# EasyEDA Pro project ProPrj_1_2026-08-19.epro

# Schematic Schematic1
Board Name: Board1; Create Date: 2026-07-23; Page Name: P1; Project Name: 1; Schematic Name: Schematic1; Update Date: 2026-07-23; Company: 嘉立创EDA; Page Size: A4; Version: V1.0
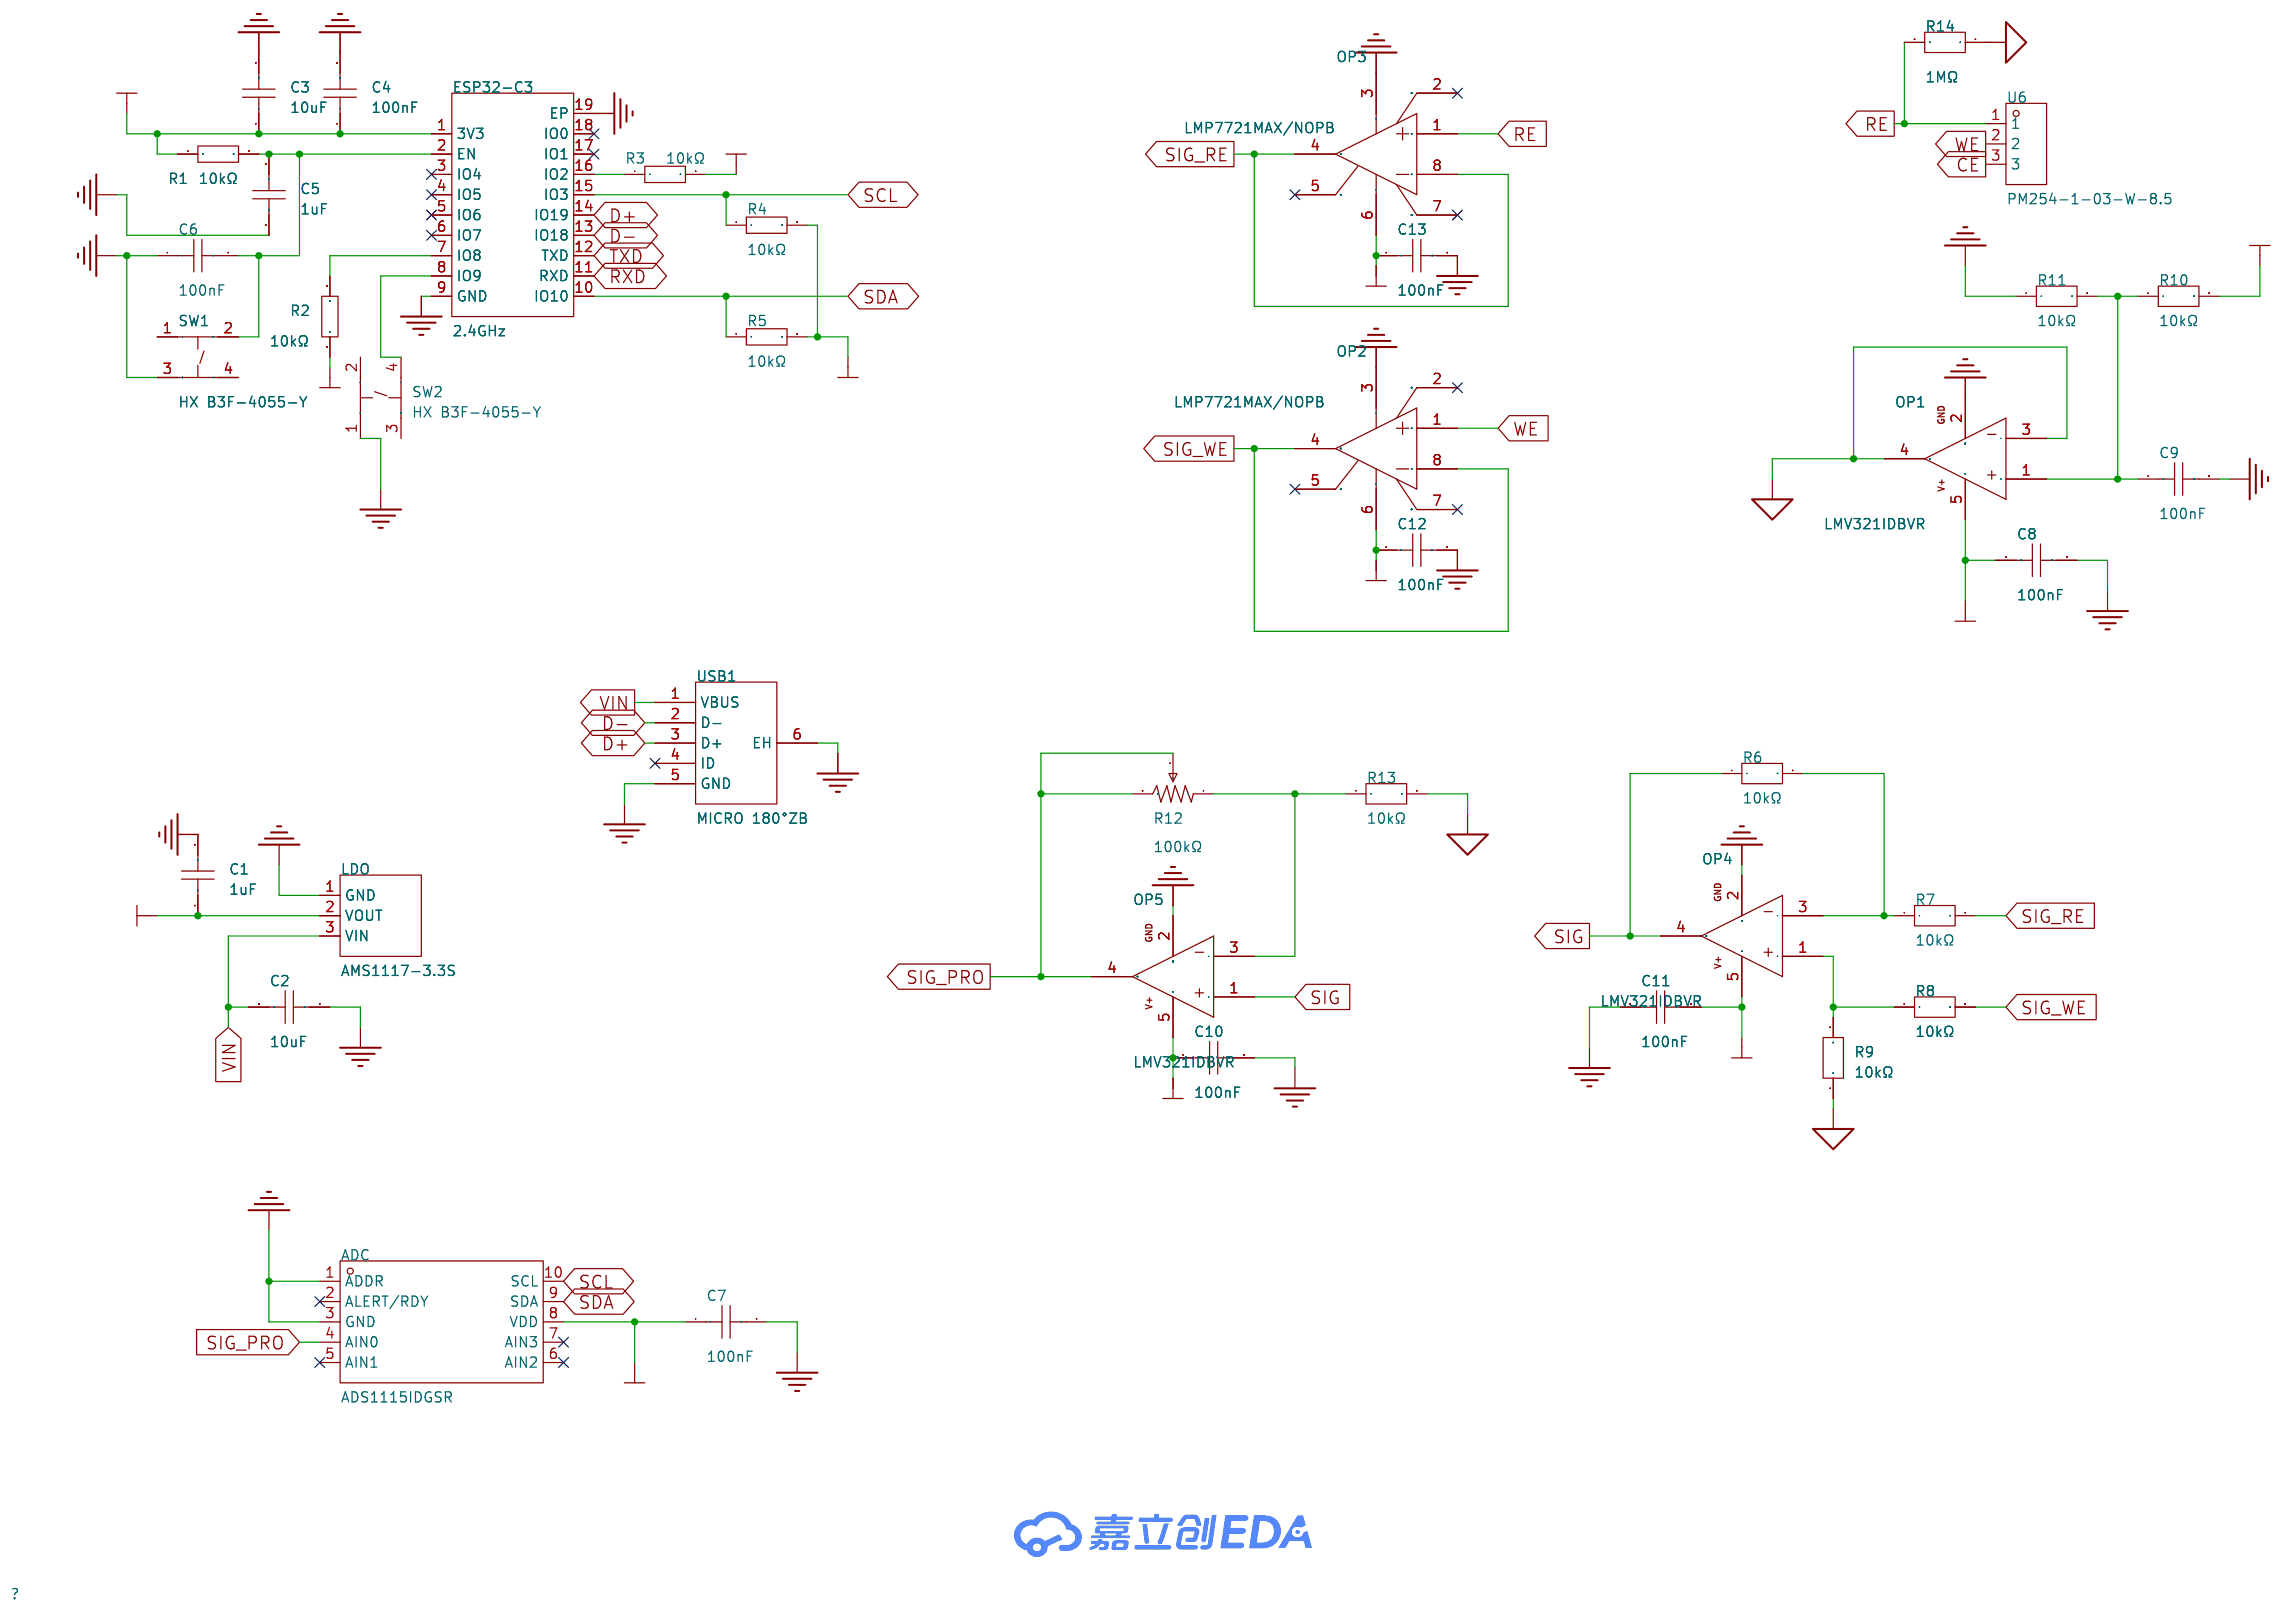
[diagram p0: schematic sheet]

## Parts
ADC  ADS1115IDGSR  [MSOP-10_L3.0-W3.0-P0.50-LS5.0-BL]
C1  1uF  [CAP-TH_L5.5-W4.0-P5.08-D0.5]
C2  10uF  [CAP-TH_L5.5-W3.8-P5.08-D0.5]
C3  10uF  [CAP-TH_L5.5-W3.8-P5.08-D0.5]
C4  100nF  [CAP-TH_L4.5-W3.5-P5.08-D0.5]
C5  1uF  [CAP-TH_L5.5-W4.0-P5.08-D0.5]
C6  100nF  [CAP-TH_L4.5-W3.5-P5.08-D0.5]
C7  100nF  [CAP-TH_L4.5-W3.5-P5.08-D0.5]
C8  100nF  [CAP-TH_L4.5-W3.5-P5.08-D0.5]
C9  100nF  [CAP-TH_L4.5-W3.5-P5.08-D0.5]
C10  100nF  [CAP-TH_L4.5-W3.5-P5.08-D0.5]
C11  100nF  [CAP-TH_L4.5-W3.5-P5.08-D0.5]
C12  100nF  [CAP-TH_L4.5-W3.5-P5.08-D0.5]
C13  100nF  [CAP-TH_L4.5-W3.5-P5.08-D0.5]
ESP32-C3  2.4GHz  [BULETM-SMD_ESPRESSIF_ESP32-C3-WROOM-02-N4-4MB]
LDO  AMS1117-3.3S  [SOT-89-3_L4.5-W2.5-P1.50-LS4.2-BR]
OP1  LMV321IDBVR  [SOT-23-5_L3.0-W1.7-P0.95-LS2.8-BR]
OP2  LMP7721MAX/NOPB  [SOIC-8_L4.9-W3.9-P1.27-LS6.0-BL]
OP3  LMP7721MAX/NOPB  [SOIC-8_L4.9-W3.9-P1.27-LS6.0-BL]
OP4  LMV321IDBVR  [SOT-23-5_L3.0-W1.7-P0.95-LS2.8-BR]
OP5  LMV321IDBVR  [SOT-23-5_L3.0-W1.7-P0.95-LS2.8-BR]
R1  10kΩ  [RES-TH_BD2.4-L6.3-P10.30-D0.6]
R2  10kΩ  [RES-TH_BD2.4-L6.3-P10.30-D0.6]
R3  10kΩ  [RES-TH_BD2.4-L6.3-P10.30-D0.6]
R4  10kΩ  [RES-TH_BD2.4-L6.3-P10.30-D0.6]
R5  10kΩ  [RES-TH_BD2.4-L6.3-P10.30-D0.6]
R6  10kΩ  [RES-TH_BD2.5-L6.8-P10.00-D0.6]
R7  10kΩ  [RES-TH_BD2.5-L6.8-P10.00-D0.6]
R8  10kΩ  [RES-TH_BD2.5-L6.8-P10.00-D0.6]
R9  10kΩ  [RES-TH_BD2.5-L6.8-P10.00-D0.6]
R10  10kΩ  [RES-TH_BD2.5-L6.8-P10.00-D0.6]
R11  10kΩ  [RES-TH_BD2.5-L6.8-P10.00-D0.6]
R12  100kΩ  [RES-ADJ-TH_3296W-L]
R13  10kΩ  [RES-TH_BD2.5-L6.8-P10.00-D0.6]
R14  1MΩ  [RES-TH_BD2.7-L6.2-P10.20-D0.4]
SW1  HX B3F-4055-Y  [SW-TH_4P-L12.0-W12.0-P5.00-LS12.5_HX-B3F-4055-Y]
SW2  HX B3F-4055-Y  [SW-TH_4P-L12.0-W12.0-P5.00-LS12.5_HX-B3F-4055-Y]
U6  PM254-1-03-W-8.5  [HDR-TH_3P-P2.54-H-F-W10.0-N]
USB1  MICRO 180°ZB  [MICRO-USB-TH_MICRO-180-ZB]

## Library data of the parts
ADC = ADS1115IDGSR: 分辨率(位):16;采样率:860Hz;工作电压:2V~5.5V;接口类型:I2C;; LCSC Part Name: 具有内部基准、振荡器和可编程比较器且兼容 I2C 的ADS111x、超小型、低功耗 860SPS、16位ADC; Supplier Part: C37593; Manufacturer: TI(德州仪器); Supplier Footprint: VSSOP-10; JLCPCB Part Class: 扩展库; Datasheet: https://www.ti.com/cn/lit/ds/symlink/ads1115.pdf; Supplier: LCSC; Resolution (Bits): 16; Sampling Rate: 860Hz; number of channels: 2; Voltage - Supply: 2V~5.5V; Interface: I2C; differential input: 是; Integral non - linearity: 1LSB; Operating Temperature: -40℃~+125℃; Clock/Oscillator: 内置; Voltage Reference: 内置; Programmable Gain: 支持; ADC architecture: Sigma-Delta; Quiescent Current (Iq): 500nA; Features: 集成调制器；多路复用器；内置数字滤波器；上电复位
C1 C5 = CD2A105KC9IER1FZAE: 容值:1uF;精度:±10%;额定电压:100V;温度系数:X7R;; LCSC Part Name: 1uF ±10% 100V; Supplier Part: C3293123; Manufacturer: Dersonic(德尔创); Supplier Footprint: 插件,P=5.08mm; JLCPCB Part Class: 扩展库; Datasheet: https://item.szlcsc.com/datasheet/CD2A105KC9IER1FZAE/3856453.html; Supplier: LCSC; Tolerance: ±10%; Voltage Rating: 100V; Temperature Coefficient: X7R
C2 C3 = CD1E106MC9BER2F100: 容值:10uF;精度:±20%;额定电压:25V;温度系数:X5R;; LCSC Part Name: 10uF ±20% 25V; Supplier Part: C2761733; Manufacturer: Dersonic(德尔创); Supplier Footprint: 插件,P=5.08mm; JLCPCB Part Class: 扩展库; Datasheet: https://item.szlcsc.com/datasheet/CD1E106MC9BER2F100/2886480.html; Supplier: LCSC; Tolerance: ±20%; Voltage Rating: 25V; Temperature Coefficient: X5R
C4 C6-C13 = CD2A104KC9BER1E100: 容值:100nF;精度:±10%;额定电压:100V;温度系数:X7R;; LCSC Part Name: 100nF ±10% 100V; Supplier Part: C2761758; Manufacturer: Dersonic(德尔创); Supplier Footprint: 插件,P=5.08mm; JLCPCB Part Class: 扩展库; Datasheet: https://item.szlcsc.com/datasheet/CD2A104KC9BER1E100/2886505.html; Supplier: LCSC; Tolerance: ±10%; Voltage Rating: 100V; Temperature Coefficient: X7R; Pin Spacing: 5.08mm
ESP32-C3 = ESP32-C3-WROOM-02-N4: 核心处理器:ESP32-C3芯片;频率:2.4GHz;发射功率:20.5dBm;; Supplier Part: C2934560; Manufacturer: ESPRESSIF(乐鑫); Supplier Footprint: VFQFN-32-EP; JLCPCB Part Class: 扩展库; Datasheet: https://atta.szlcsc.com/upload/public/pdf/source/20220106/F07459EFFE1D7CBA94B4FB8A075146A6.pdf; Supplier: LCSC; Core Processor: ESP32-C3芯片; Support Interface: I2C；GPIO；SPI；JTAG；UART；USB；I2S; Output Power: 20.5dBm
LDO = AMS1117-3.3S_C347256: 输出极性:正极;工作电压:18V;输出电压:3.3V;输出电流:1A;电源纹波抑制比(PSRR):60dB@(120Hz);输出类型:固定;; LCSC Part Name: 3.3V 1A 18V; Supplier Part: C347256; Manufacturer: UMW(友台半导体); Supplier Footprint: SOT-89; JLCPCB Part Class: 扩展库; Datasheet: https://item.szlcsc.com/datasheet/AMS1117-3.3S/323916.html; Supplier: LCSC; Output Configuration: 正极; Voltage - Supply: 18V; Output Voltage: 3.3V; Output Current: 1A; Power Supply Rejection Ratio (PSRR): 60dB@(120Hz); Voltage Dropout: 1.3V@(1A); standby current: 5mA; Noise: 0.003%Vout; Features: 过流保护; Operating Temperature: -40℃~+125℃; Output Type: 固定; Number of Outputs: 1
OP1 OP4 OP5 = LMV321IDBVR_C7972: 放大器数:1;轨到轨:轨到轨输出;增益带宽积(GBW):1MHz;输入失调电压(Vos):7mV;压摆率(SR):1V/us;输入偏置电流(Ib):11nA;; LCSC Part Name: 低电压轨到轨输出运算放大器; Supplier Part: C7972; Manufacturer: TI(德州仪器); Supplier Footprint: SOT-23-5; JLCPCB Part Class: 扩展库; Datasheet: https://www.ti.com/cn/lit/gpn/lmv321; Supplier: LCSC; Number of Channels: 1; Maximum Power Supply Range (Vdd-Vss): 5.5V; Rail to Rail: 轨到轨输出; Gain Bandwidth Product: 1MHz; Vos - Input Offset Voltage: 7mV; Input Offset Voltage Drift(Vos TC): 9uV/℃; Slew Rate: 1V/us; Ib - Input Bias Current: 11nA; Input Offset Current(Ios): 5nA; Input Voltage Noise Density: 46nV/√Hz@1kHz; Common Mode Rejection Ratio(CMRR): 63dB; Quiescent Current: 170uA; Output Current: 5mA; Operating Temperature: -40℃~+125℃; Single supply: 2.7V~5.5V
OP2 OP3 = LMP7721MAX/NOPB: 放大器数:1;轨到轨:轨到轨输出;增益带宽积(GBW):17MHz;输入失调电压(Vos):26uV;压摆率(SR):12.76V/us;输入偏置电流(Ib):0.003pA;; LCSC Part Name: 超低输入偏置电流精密放大器; Supplier Part: C2864387; Manufacturer: TI(德州仪器); Supplier Footprint: SOIC-8; JLCPCB Part Class: 扩展库; Datasheet: https://www.ti.com/cn/lit/gpn/lmp7721; Supplier: LCSC; Number of Channels: 1; Maximum Power Supply Range (Vdd-Vss): 5.5V; Rail to Rail: 轨到轨输出; Gain Bandwidth Product: 17MHz; Vos - Input Offset Voltage: 26uV; Input Offset Voltage Drift(Vos TC): 1.5uV/℃; Slew Rate: 12.76V/us; Ib - Input Bias Current: 0.003pA; Input Offset Current(Ios): 0.006pA; Input Voltage Noise Density: 6.5nV/√Hz@1kHz; Common Mode Rejection Ratio(CMRR): 100dB; Quiescent Current: 1.3mA; Output Current: 46mA; Operating Temperature: -40℃~+125℃; Single supply: 1.8V~5.5V
R1-R5 = MFR-25FTE52-10K: 电阻类型:金属膜电阻;阻值:10kΩ;精度:±1%;功率:250mW;温度系数:±50ppm/℃;; LCSC Part Name: 金属膜电阻 10kΩ ±1% 250mW 铜脚，圆柱状直插; Supplier Part: C172967; Manufacturer: YAGEO(国巨); Supplier Footprint: 插件,D2.4xL6.3mm; JLCPCB Part Class: 扩展库; Datasheet: https://item.szlcsc.com/datasheet/MFR-25FTE52-10K/184356.html; Supplier: LCSC; Type: 金属膜电阻; Tolerance: ±1%; Power(Watts): 250mW; Temperature Coefficient: ±50ppm/℃; Operating Temperature: -55℃~+155℃
R6-R11 R13 = MMFR2568B10K0V9: 电阻类型:金属膜电阻;阻值:10kΩ;精度:±0.1%;功率:250mW;温度系数:±5ppm/℃;; LCSC Part Name: 金属膜电阻 10kΩ ±0.1% 250mW; Supplier Part: C18164721; Manufacturer: RESI(开步睿思); Supplier Footprint: 插件,D2.5xL6.8mm; JLCPCB Part Class: 扩展库; Datasheet: https://item.szlcsc.com/datasheet/MMFR2568B10K0V9/19306716.html; Supplier: LCSC; Type: 金属膜电阻; Tolerance: ±0.1%; Voltage-Supply(Max): 250V; Power(Watts): 250mW; Temperature Coefficient: ±5ppm/℃; Operating Temperature: -55℃~+125℃
R12 = 3296W-104-3H: 阻值:100kΩ;精度:±10%;功率:500mW;温度系数:±250ppm/℃;; LCSC Part Name: 3296W 100KΩ±10% 高精度 高可靠 高稳定; Supplier Part: C48641918; Manufacturer: BAOTER(宝特); Supplier Footprint: 插件-3P,9.5x4.8mm; JLCPCB Part Class: 扩展库; Datasheet: https://item.szlcsc.com/datasheet/3296W-104-3H/50920181.html; Supplier: LCSC; Tolerance: ±10%; Power(Watts): 500mW; Temperature Coefficient: ±250ppm/℃; Number of Turns: 28
R14 = MF1/4W-1M±1%-OT52: 电阻类型:金属膜电阻;阻值:1MΩ;精度:±1%;功率:250mW;温度系数:±100ppm/℃;; LCSC Part Name: 金属膜电阻 1MΩ ±1% 250mW; Supplier Part: C2903250; Manufacturer: VO(翔胜); Supplier Footprint: 插件,D2.7xL6.2mm; JLCPCB Part Class: 扩展库; Datasheet: https://atta.szlcsc.com/upload/public/pdf/source/20200609/C601728_5AA4C0C8E12E11069DA2C3356F29D1F2.pdf; Supplier: LCSC; Type: 金属膜电阻; Tolerance: ±1%; Overload Voltage (Max): 250V; Power(Watts): 250mW; Temperature Coefficient: ±100ppm/℃; Operating Temperature Range: -55℃~+155℃
SW1 SW2 = HX B3F-4055-Y: 电路结构:单刀单掷;按钮形状:方形按钮;作用力:2.5N;安装方式:直插;开关长度:11.8mm;开关宽度:11.8mm;开关高度:7.3mm;带支架:不带支架;触点电流:50mA;额定电压:12V;带灯:无;工作寿命:10万次;; LCSC Part Name: 12*12*7.3mm 直插 轻触开关; Supplier Part: C36498965; Manufacturer: hanxia(韩下); Supplier Footprint: 插件-4P,11.8x11.8mm; JLCPCB Part Class: 扩展库; Datasheet: https://item.szlcsc.com/datasheet/HX%2520B3F-4055-Y/38220907.html; Supplier: LCSC; Circuit: 单刀单掷; Actuator Style: 方形按钮; Operating Force: 2.5N; Mounting Type: 直插; Length: 11.8mm; Width: 11.8mm; Switch Height: 7.3mm; with Bracket: 不带支架; Contact Current: 50mA; Voltage Rating: 12V; Actuator/Cap Color: 黑色; With Lamp: 无; Termination Style: PC引脚; Life: 10万次; Operating Temperature: -25℃~+70℃
U6 = PM254-1-03-W-8.5: 插孔结构:1x3P;间距:2.54mm;行距:-;圆孔/方孔:方孔;安装方式:弯插;排数:单排;总孔位数:3P;额定电流:3A;额定电压:-;插孔方向:侧面;塑高:8.5mm;触头材质:铜合金;工作温度:-40℃~+105℃;; LCSC Part Name: 1x3P 间距:2.54mm 弯插; Supplier Part: C2897385; Manufacturer: HCTL(华灿天禄); Supplier Footprint: 弯插,P=2.54mm; JLCPCB Part Class: 扩展库; Datasheet: https://item.szlcsc.com/datasheet/PM254-1-03-W-8.5/3142390.html; Supplier: LCSC; Holes Structure: 1x3P; Pitch: 2.54mm; Circular Hole / Square Hole: 方孔; Mounting Type: 弯插; Number of Rows: 单排; Number of Positions: 3P; Current Rating: 3A; Holes Direction: 侧面; Insulation Height: 8.5mm; Contact Material: 铜合金; Operating Temperature: -40℃~+105℃
USB1 = MICRO 180°ZB: 连接器类型:Micro-B;协议标准:USB 2.0;公母:母;安装方式:直插;触点数量:5P;端口数量:1;额定电流 - 电源:1A;工作温度:-30℃~+80℃;; LCSC Part Name: Micro-B 母 直插; Supplier Part: C668588; Manufacturer: SHOU HAN(首韩); Supplier Footprint: 插件; JLCPCB Part Class: 扩展库; Datasheet: https://item.szlcsc.com/datasheet/MICRO%2520180%25C2%25B0ZB/698531.html; Supplier: LCSC; Connector Type: Micro-B; Protocol Standard: USB 2.0; Gender: 母; Mounting Type: 直插; Number of Contacts: 5P; Number of Ports: 1; Current Rating-Power: 1A; Voltage Rating: 30V; Connect-Disconnect Life: 3千次; Detection color: 黑色; Operating Temperature: -30℃~+80℃

## Nets
GND: ADC.1(ADDR) ADC.3(GND) C1.2 C2.1 C3.2 C4.2 C5.1 C6.1 C7.2 C8.2 C9.2 C10.2 C11.1 C12.2 C13.2 ESP32-C3.9(GND) ESP32-C3.19(EP) LDO.1(GND) OP1.2(GND) OP2.3(V-) OP3.3(V-) OP4.2(GND) OP5.2(GND) R11.1 SW1.3 SW2.1 USB1.5(GND) USB1.6(EH)
VCC: ADC.8(VDD) C1.1 C3.1 C4.1 C7.1 C8.1 C10.1 C11.2 C12.1 C13.1 ESP32-C3.1(3V3) LDO.2(VOUT) OP1.5(V+) OP2.6(V+) OP3.6(V+) OP4.5(V+) OP5.5(V+) R1.1 R2.1 R3.2 R4.2 R5.2 R10.2
VIN: C2.2 LDO.3(VIN) USB1.1(VBUS)
BIAS: OP1.3(-) OP1.4(OUT) R9.1 R13.2 R14.1
CE: U6.3
D+: ESP32-C3.14(IO19) USB1.3(D+)
D-: ESP32-C3.13(IO18) USB1.2(D-)
RE: OP3.1(+IN) R14.2 U6.1
RXD: ESP32-C3.11(RXD)
SCL: ADC.10(SCL) ESP32-C3.15(IO3) R4.1
SDA: ADC.9(SDA) ESP32-C3.10(IO10) R5.1
SIG: OP4.4(OUT) OP5.1(+) R6.1
SIG_PRO: ADC.4(AIN0) OP5.4(OUT) R12.2 R12.3
SIG_RE: OP3.4(VOUT) OP3.8(-IN) R7.2
SIG_WE: OP2.4(VOUT) OP2.8(-IN) R8.2
TXD: ESP32-C3.12(TXD)
WE: OP2.1(+IN) U6.2
$1N832: C5.2 C6.2 ESP32-C3.2(EN) R1.2 SW1.2
$1N835: ESP32-C3.8(IO9) SW2.4
$1N839: ESP32-C3.7(IO8) R2.2
$1N841: ESP32-C3.16(IO2) R3.1
$1N2241: OP4.1(+) R8.1 R9.2
$1N2280: OP4.3(-) R6.2 R7.1
$1N4903: C9.1 OP1.1(+) R10.1 R11.2
$1N5110: OP5.3(-) R12.1 R13.1

Not connected (* = marked no-connect by the designer): ADC 2(ALERT/RDY)* 5(AIN1)* 6(AIN2)* 7(AIN3)*; ESP32-C3 3(IO4)* 4(IO5)* 5(IO6)* 6(IO7)* 17(IO1)* 18(IO0)*; OP2 2(N/C)* 5(N/C)* 7(N/C)*; OP3 2(N/C)* 5(N/C)* 7(N/C)*; SW1 1 4; SW2 2 3; USB1 4(ID)*

# Board PCB1
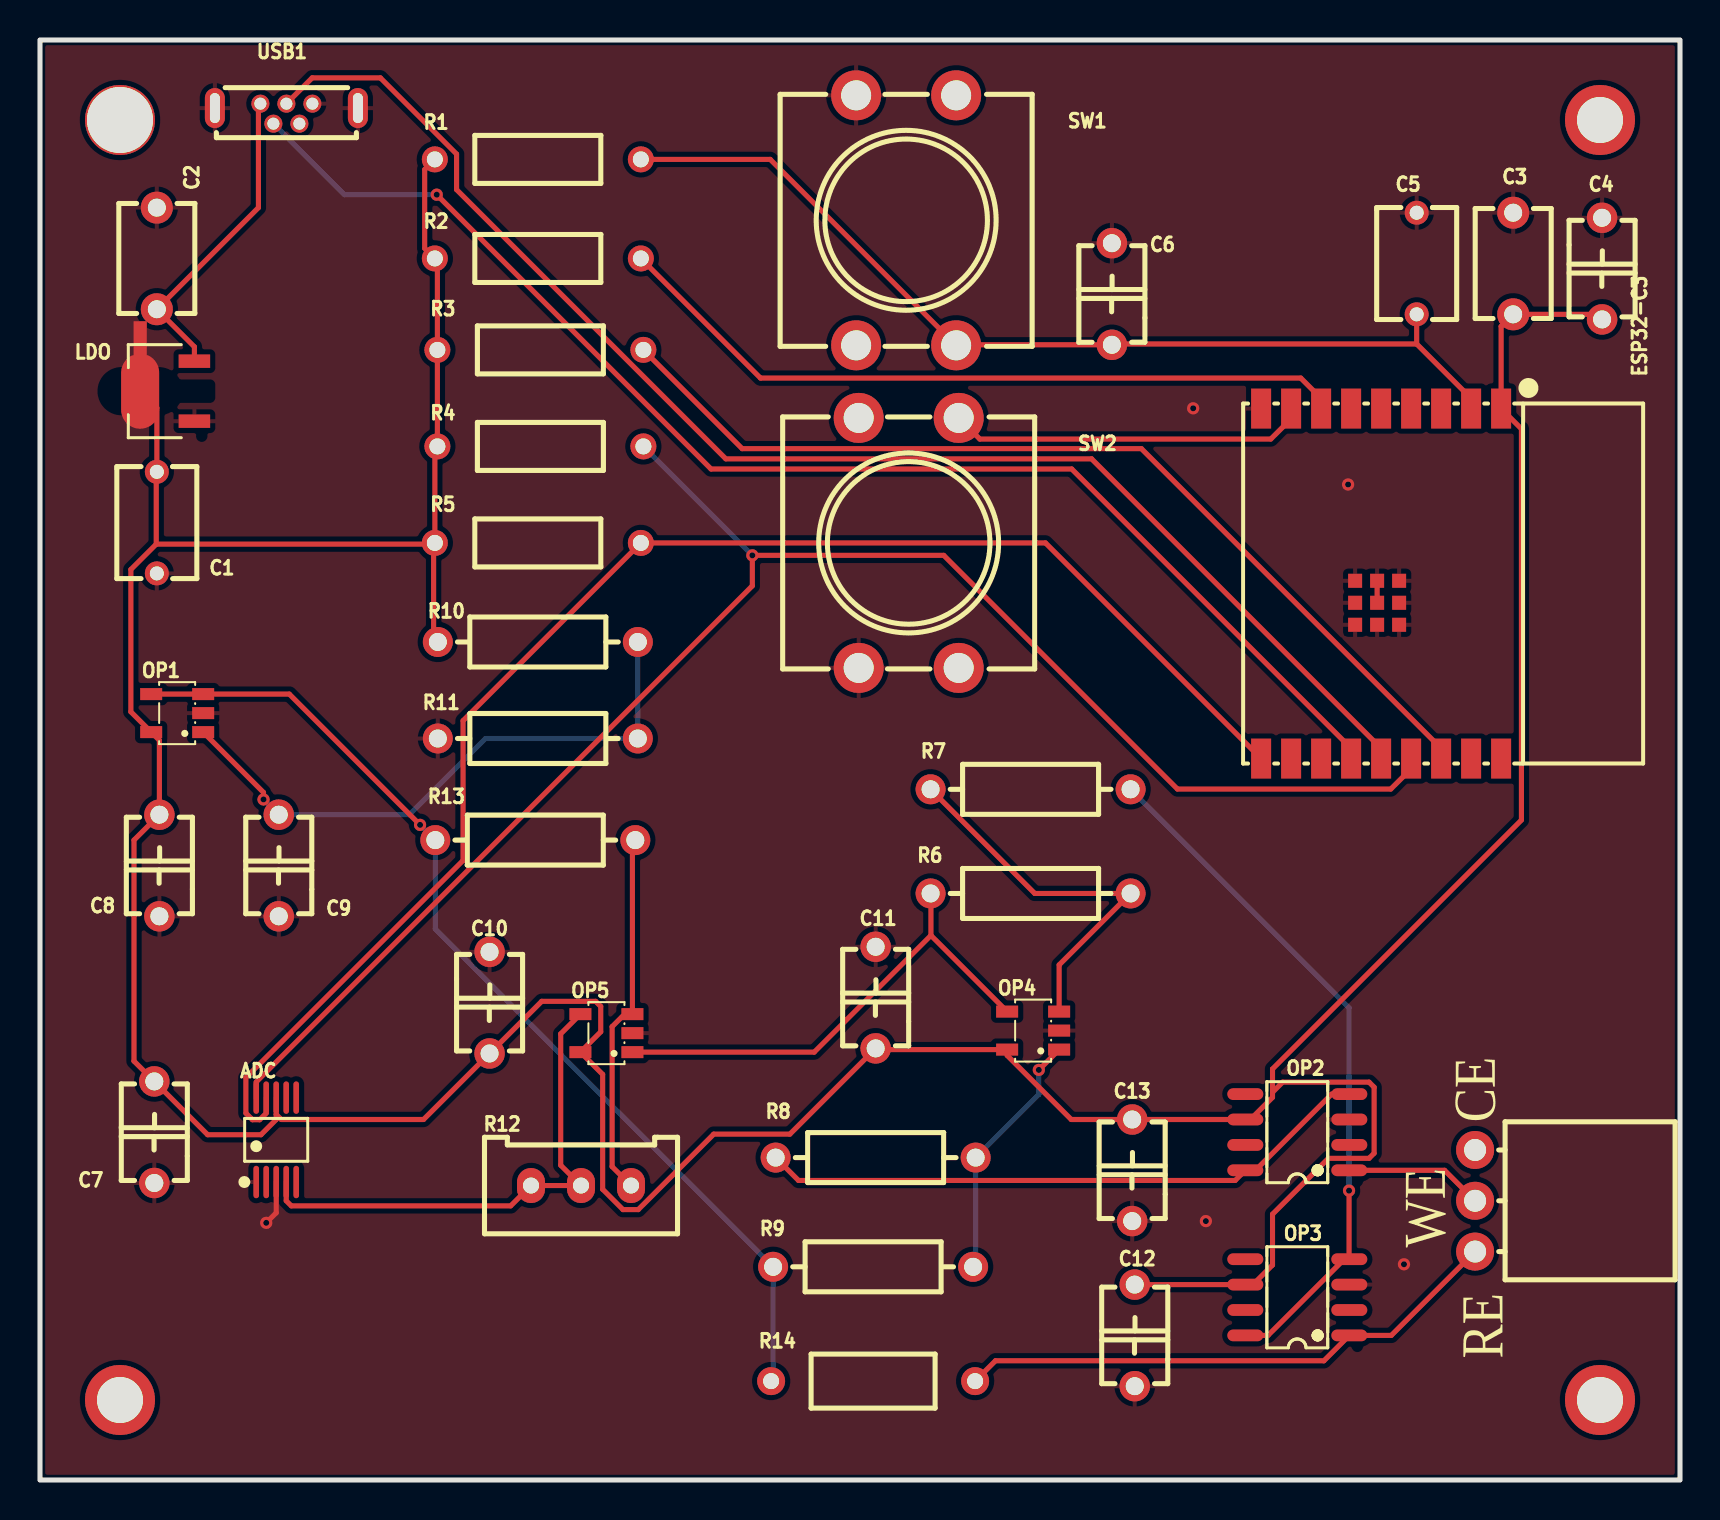
[diagram p1: board, top side]
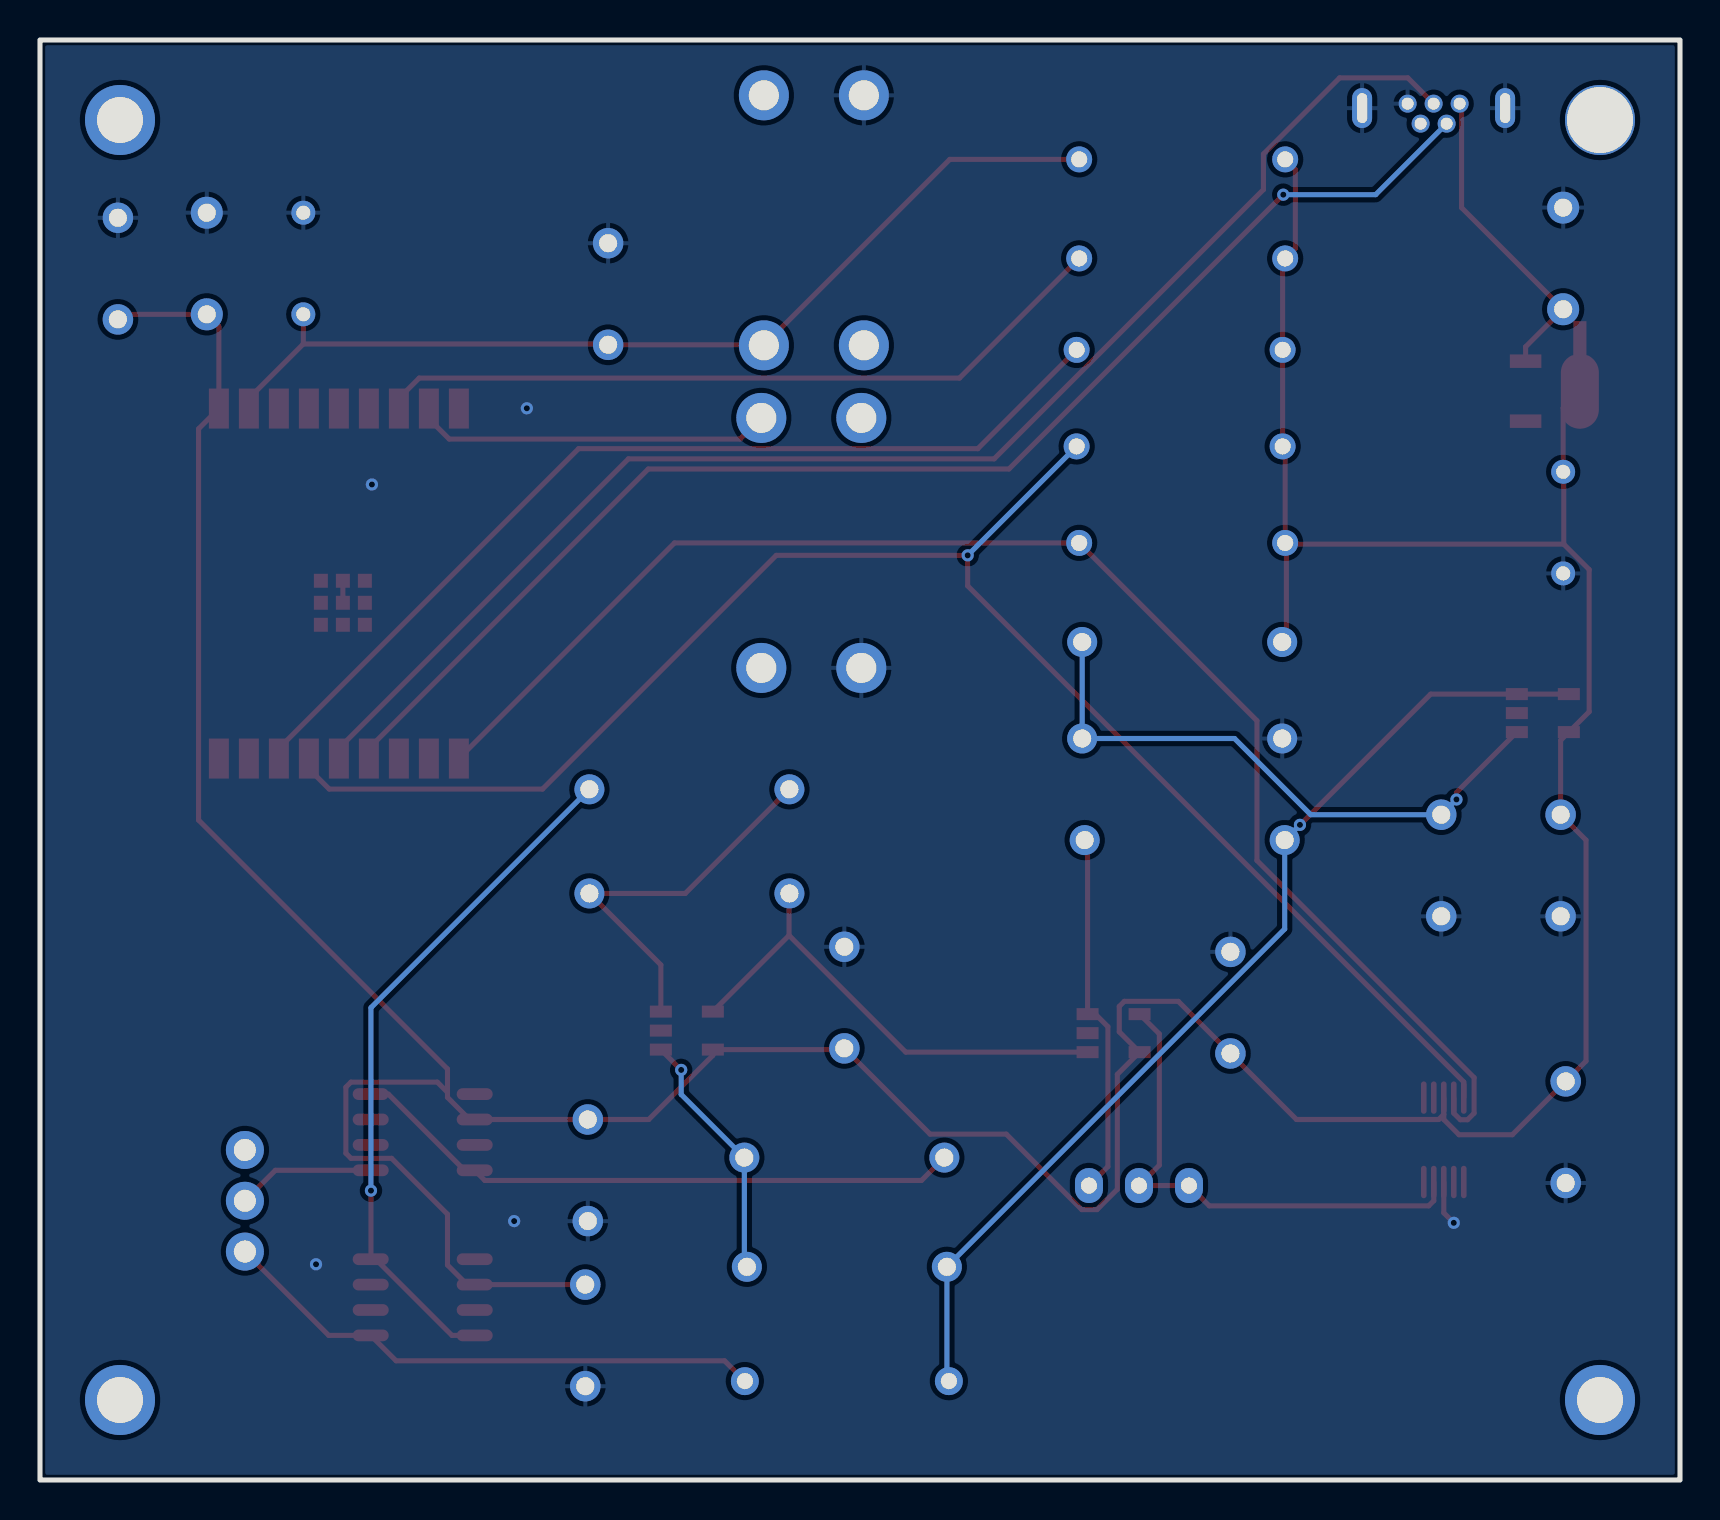
[diagram p2: board, bottom side, seen from below]

Outline 82 x 72 mm; copper layers: Top Layer, Bottom Layer. Coordinates in mm from the lower left corner of the outline.
Outline path: rectangle 0,72 82,0
Stack: Top Layer 0.035mm / Dielectric1 1.51mm FR4 er 4.5 / Bottom Layer 0.035mm

## Design rules (mm)
template: JLCPCB Capability(Two Layers Board)
spacing copperThickness1oz (default): track to track 0.102, other pairs 0.152 to 0.3
spacing copperThickness2oz: track to track 0.203, other pairs 0.152 to 0.3
track width copperThickness1oz (default): min 0.127, default 0.254, max 2.54
track width copperThickness2oz: min 0.203, default 0.254, max 2.54
differential pair differentialPair (default): width min 0.127, default 0.254, max 2.54; gap min 0.152, default 0.152
via viaSize (default): diameter min 0.5, default 0.61, max 10; hole min 0.3, default 0.305, max 6.3

## Placement (name value [footprint] x y rotation side)
ADC  ADS1115IDGSR  [MSOP-10_L3.0-W3.0-P0.50-LS5.0-BL]  11.81 17.01 0 top
C1  1uF  [CAP-TH_L5.5-W4.0-P5.08-D0.5]  5.84 47.87 270 top
C2  10uF  [CAP-TH_L5.5-W3.8-P5.08-D0.5]  5.84 61.08 270 top
C3  10uF  [CAP-TH_L5.5-W3.8-P5.08-D0.5]  73.66 60.82 90 top
C4  100nF  [CAP-TH_L4.5-W3.5-P5.08-D0.5]  78.1 60.57 90 top
C5  1uF  [CAP-TH_L5.5-W4.0-P5.08-D0.5]  68.83 60.82 270 top
C6  100nF  [CAP-TH_L4.5-W3.5-P5.08-D0.5]  53.59 59.3 270 top
C7  100nF  [CAP-TH_L4.5-W3.5-P5.08-D0.5]  5.72 17.39 270 top
C8  100nF  [CAP-TH_L4.5-W3.5-P5.08-D0.5]  5.97 30.72 270 top
C9  100nF  [CAP-TH_L4.5-W3.5-P5.08-D0.5]  11.94 30.72 270 top
C10  100nF  [CAP-TH_L4.5-W3.5-P5.08-D0.5]  22.48 23.87 90 top
C11  100nF  [CAP-TH_L4.5-W3.5-P5.08-D0.5]  41.78 24.12 270 top
C12  100nF  [CAP-TH_L4.5-W3.5-P5.08-D0.5]  54.74 7.23 270 top
C13  100nF  [CAP-TH_L4.5-W3.5-P5.08-D0.5]  54.61 15.48 270 top
ESP32-C3  2.4GHz  [BULETM-SMD_ESPRESSIF_ESP32-C3-WROOM-02-N4-4MB]  67.06 44.82 270 top
LDO  AMS1117-3.3S  [SOT-89-3_L4.5-W2.5-P1.50-LS4.2-BR]  6.36 54.44 0 top
NOREF  -  [Pad_e3357]  4 4 0 top
NOREF#2  -  [Pad_e3116]  4 68 0 top
NOREF#3  -  [Pad_e3359]  78 68 0 top
NOREF#4  -  [Pad_e3553]  78 4 0 top
OP1  LMV321IDBVR  [SOT-23-5_L3.0-W1.7-P0.95-LS2.8-BR]  6.86 38.34 0 top
OP2  LMP7721MAX/NOPB  [SOIC-8_L4.9-W3.9-P1.27-LS6.0-BL]  62.87 17.39 90 top
OP3  LMP7721MAX/NOPB  [SOIC-8_L4.9-W3.9-P1.27-LS6.0-BL]  62.87 9.13 90 top
OP4  LMV321IDBVR  [SOT-23-5_L3.0-W1.7-P0.95-LS2.8-BR]  49.66 22.47 0 top
OP5  LMV321IDBVR  [SOT-23-5_L3.0-W1.7-P0.95-LS2.8-BR]  28.32 22.34 0 top
R1  10kΩ  [RES-TH_BD2.4-L6.3-P10.30-D0.6]  24.89 66.03 0 top
R2  10kΩ  [RES-TH_BD2.4-L6.3-P10.30-D0.6]  24.89 61.08 0 top
R3  10kΩ  [RES-TH_BD2.4-L6.3-P10.30-D0.6]  25.02 56.51 180 top
R4  10kΩ  [RES-TH_BD2.4-L6.3-P10.30-D0.6]  25.02 51.68 180 top
R5  10kΩ  [RES-TH_BD2.4-L6.3-P10.30-D0.6]  24.89 46.85 180 top
R6  10kΩ  [RES-TH_BD2.5-L6.8-P10.00-D0.6]  49.53 29.33 0 top
R7  10kΩ  [RES-TH_BD2.5-L6.8-P10.00-D0.6]  49.53 34.53 0 top
R8  10kΩ  [RES-TH_BD2.5-L6.8-P10.00-D0.6]  41.78 16.12 180 top
R9  10kΩ  [RES-TH_BD2.5-L6.8-P10.00-D0.6]  41.66 10.66 0 top
R10  10kΩ  [RES-TH_BD2.5-L6.8-P10.00-D0.6]  24.89 41.9 180 top
R11  10kΩ  [RES-TH_BD2.5-L6.8-P10.00-D0.6]  24.89 37.08 0 top
R12  100kΩ  [RES-ADJ-TH_3296W-L]  27.05 14.72 0 top
R13  10kΩ  [RES-TH_BD2.5-L6.8-P10.00-D0.6]  24.76 32 180 top
R14  1MΩ  [RES-TH_BD2.7-L6.2-P10.20-D0.4]  41.66 4.94 0 top
SW1  HX B3F-4055-Y  [SW-TH_4P-L12.0-W12.0-P5.00-LS12.5_HX-B3F-4055-Y]  43.31 62.98 270 top
SW2  HX B3F-4055-Y  [SW-TH_4P-L12.0-W12.0-P5.00-LS12.5_HX-B3F-4055-Y]  43.43 46.85 90 top
U6  PM254-1-03-W-8.5  [HDR-TH_3P-P2.54-H-F-W10.0-N]  71.75 13.96 90 top
USB1  MICRO 180°ZB  [MICRO-USB-TH_MICRO-180-ZB]  12.32 68.32 0 top

## Footprints (pads in the part's own frame, mm; a bottom-side part is the same pattern mirrored in y, then rotated)
BULETM-SMD_ESPRESSIF_ESP32-C3-WROOM-02-N4-4MB
  rect 2x1 smd: 1(-8.75,6) 2(-8.75,4.5) 3(-8.75,3) 4(-8.75,1.5) 5(-8.75,0) 6(-8.75,-1.5) 7(-8.75,-3) 8(-8.75,-4.5) 9(-8.75,-6) 10(8.75,-6) 11(8.75,-4.5) 12(8.75,-3) 13(8.75,-1.5) 14(8.75,0) 15(8.75,1.5) 16(8.75,3) 17(8.75,4.5) 18(8.75,6)
  rect 0.7x0.7 smd: 19(-0.14,0.9) 19(-0.14,-0.2) 19(-0.14,-1.3) 19(0.96,0.9) 19(0.96,-0.2) 19(0.96,-1.3) 19(2.06,0.9) 19(2.06,-0.2) 19(2.06,-1.3)
CAP-TH_L4.5-W3.5-P5.08-D0.5
  round 1.524 hole 0.9: 1(-2.54,0) 2(2.54,0)
CAP-TH_L5.5-W3.8-P5.08-D0.5
  round 1.6 hole 0.9: 1(-2.54,0) 2(2.54,0)
CAP-TH_L5.5-W4.0-P5.08-D0.5
  round 1.2 hole 0.7: 1(-2.54,0) 2(2.54,0)
HDR-TH_3P-P2.54-H-F-W10.0-N
  round 1.9 hole 1.1: 1(-2.54,0) 2(0,0) 3(2.54,0)
MICRO-USB-TH_MICRO-180-ZB
  round 0.9 hole 0.6: 1(-1.3,0.5) 2(-0.65,-0.5) 3(0,0.5) 4(0.65,-0.5) 5(1.3,0.5)
  oval 1x2 hole 0.5x1.5: 6(-3.575,0.28) 6(3.575,0.28)
MSOP-10_L3.0-W3.0-P0.50-LS5.0-BL
  oval 0.28x1.62 smd: 1(-1,-2.11) 2(-0.5,-2.11) 3(0,-2.11) 4(0.5,-2.11) 5(1,-2.11) 6(1,2.11) 7(0.5,2.11) 8(0,2.11) 9(-0.5,2.11) 10(-1,2.11)
Pad_e3116
  round 3.5 hole 3.3x2.3: 1(0,0)
Pad_e3357
  round 3.5 hole 2.3: 2(0,0)
Pad_e3359
  round 3.5 hole 2.3: 3(0,0)
Pad_e3553
  round 3.5 hole 2.3: 1(0,0)
RES-ADJ-TH_3296W-L
  oval 1.4x1.75 hole 0.8: 1(2.5,0) 2(0,0) 3(-2.5,0)
RES-TH_BD2.4-L6.3-P10.30-D0.6
  round 1.3 hole 0.8: 1(-5.15,0) 2(5.15,0)
RES-TH_BD2.5-L6.8-P10.00-D0.6
  round 1.5 hole 0.9: 1(-5,0) 2(5,0)
RES-TH_BD2.7-L6.2-P10.20-D0.4
  round 1.4 hole 0.8: 1(-5.1,0) 2(5.1,0)
SOIC-8_L4.9-W3.9-P1.27-LS6.0-BL
  oval 0.588x1.8 smd: 1(-1.905,-2.6) 2(-0.635,-2.6) 3(0.635,-2.6) 4(1.905,-2.6) 5(1.905,2.6) 6(0.635,2.6) 7(-0.635,2.6) 8(-1.905,2.6)
SOT-23-5_L3.0-W1.7-P0.95-LS2.8-BR
  rect 1.1x0.6 smd: 1(1.3,-0.95) 2(1.3,0) 3(1.3,0.95) 4(-1.3,0.95) 5(-1.3,-0.95)
SOT-89-3_L4.5-W2.5-P1.50-LS4.2-BR
  rect 1.575x0.672 smd: 1(1.356,-1.5) 3(1.356,1.5)
  custom 1.9x5.377 smd: 2(-1.356,0)
SW-TH_4P-L12.0-W12.0-P5.00-LS12.5_HX-B3F-4055-Y
  round 2.5 hole 1.5: 1(-6.25,2.5) 2(6.25,2.5) 3(-6.25,-2.5) 4(6.25,-2.5)

## Nets
As in the schematic.

Pads without a net: ADC 2 5 6 7; ESP32-C3 3 4 5 6 17 18; NOREF#2 1; OP2 2 5 7; OP3 2 5 7; SW1 1 4; SW2 2 3; USB1 4

## Via types
v1: diameter 0.61, hole 0.305, Top Layer to Bottom Layer, 11 vias

## Routing (per net, layer and track width the routed paths; a pad name or vN(x,y) marks a point on that pad's centre or on a via; arc(x,y) is an arc through that point)
GND: length 3.3
  Top Layer w0.254: ADC.3 11.81,13.36 v1(11.31,12.86) ; ESP32-C3.19 ESP32-C3.19
  vias: v1(57.66,53.58) v1(58.29,12.94) v1(65.41,49.78) v1(68.2,10.79)
VCC: length 226.8
  Top Layer w0.254: R1.1 19.23,65.52 19.23,61.59 R2.1 19.87,60.95 R3.2 R4.2 19.74,51.55 R5.2 19.68,46.79 ; 61.63,19.39 62.13,19.89 66.45,19.89 66.71,19.64 66.71,16.34 66.45,16.08 64.42,16.08 61.63,13.29 61.63,10.75 60.65,9.77 C12.1 ; 61.63,19.39 61.63,19.13 60.61,18.12 60.36,18.12 60.26,18.03 C13.1 51.56,18.03 48.36,21.23 OP4.5 41.84,21.52 C11.2 37.5,17.29 33.69,17.29 29.91,13.52 29.15,13.52 28.13,14.53 28.13,20.28 OP5.5 28.04,22.41 28.04,23.68 27.78,23.93 25.09,23.93 C10.1 19.18,18.03 12.06,18.03 11.81,18.28 ; 61.63,19.39 61.63,20.55 74.07,33 74.07,52.56 ESP32-C3.1 73.06,57.68 C3.1 77.85,58.28 C4.1 ; LDO.2 5.84,53.61 C1.1 5.81,50.38 5.81,46.79 ; 11.81,18.28 11.81,18.03 11.05,17.26 8.38,17.26 C7.1 4.7,20.95 4.7,32 C8.1 5.97,36.98 OP1.5 4.54,38.41 4.54,45.52 5.81,46.79 ; 11.81,18.28 ADC.8 ; 19.68,46.79 5.81,46.79 ; 19.68,46.79 19.68,42.11 R10.2
VIN: length 15.8
  Top Layer w0.254: LDO.3 7.72,56.66 C2.2 10.92,63.62 10.92,68.72 USB1.1
BIAS: length 51.3
  Top Layer w0.254: OP1.4 OP1.3 12.47,39.3 v1(19,32.76)
  Bottom Layer w0.254: v1(19,32.76) R13.2 19.76,27.55 R9.1 36.66,5.04 R14.1
D+: length 70.7
  Top Layer w0.254: ESP32-C3.14 67.06,36.58 52.58,51.06 34.29,51.06 20.83,64.52 20.83,66.3 17.02,70.11 13.61,70.11 USB1.3
D-: length 67.3
  Top Layer w0.254: ESP32-C3.13 65.56,36.58 51.59,50.55 33.55,50.55 v1(19.84,64.27)
  Bottom Layer w0.254: v1(19.84,64.27) 15.22,64.27 USB1.2
RE: length 27.7
  Top Layer w0.254: 71.75,11.42 67.56,7.23 OP3.1 64.19,5.96 47.77,5.96 R14.2
SCL: length 83.8
  Top Layer w0.254: ADC.10 10.81,19.9 35.62,44.71 v1(35.62,46.23) 45.19,46.23 56.87,34.55 67.54,34.55 68.56,35.56 ESP32-C3.15
  Bottom Layer w0.254: v1(35.62,46.23) R4.1
SDA: length 74.2
  Top Layer w0.254: ADC.9 11.31,18.34 10.98,18.01 10.62,18.01 10.3,18.34 10.3,20.12 21.15,30.98 21.15,37.96 R5.1 50.27,46.85 ESP32-C3.10
SIG: length 24.8
  Top Layer w0.254: 44.55,27.23 44.55,29.31 R6.1 ; 44.55,27.23 38.71,21.39 OP5.1 ; 44.55,27.23 OP4.4
SIG_PRO: length 25.6
  Top Layer w0.254: OP5.4 26.03,22.31 26.03,15.74 R12.2 R12.3 23.53,13.71 12.56,13.71 12.31,13.96 ADC.4
SIG_RE: length 34.8
  Top Layer w0.254: 60.26,7.23 61.4,7.23 65.21,11.04 OP3.4 65.45,11.05 v1(65.45,14.47)
  Bottom Layer w0.254: R7.2 65.45,23.61 v1(65.45,14.47)
SIG_WE: length 30.9
  Top Layer w0.254: OP2.4 64.58,19.3 60.77,15.48 60.26,15.48 59.76,14.98 37.93,14.98 R8.2
WE: length 6.9
  Top Layer w0.254: OP2.1 70.23,15.48 U6.2
$1N832: length 48.5
  Top Layer w0.254: R1.2 36.51,66.03 SW1.2 45.83,56.76 C6.2 53.64,56.8 68.83,56.8 ; 68.83,56.8 71.56,54.08 ESP32-C3.2 ; 68.83,56.8 C5.2
$1N835: length 18
  Top Layer w0.254: SW2.4 46.99,52.05 61.54,52.05 62.56,53.06 ESP32-C3.8
$1N839: length 37.4
  Top Layer w0.254: R2.2 36.02,55.1 63.04,55.1 64.06,54.08 ESP32-C3.7
$1N841: length 48.6
  Top Layer w0.254: ESP32-C3.16 70.06,36.58 55.07,51.57 35.11,51.57 R3.1
$1N2241: length 12.6
  Top Layer w0.254: 50.96,21.52 v1(49.94,20.5)
  Bottom Layer w0.254: v1(49.94,20.5) 49.94,19.28 R8.1 46.78,10.79 R9.2
$1N2280: length 19.5
  Top Layer w0.254: 50.96,23.42 50.96,25.75 R6.2 49.74,29.33 R7.1
$1N4903: length 30.1
  Top Layer w0.254: v1(11.18,34.03) 11.18,34.38 OP1.1
  Bottom Layer w0.254: v1(11.18,34.03) C9.1 18.46,33.27 22.27,37.08 R11.2 R10.1
$1N5110: length 18.4
  Top Layer w0.254: R13.1 29.62,31.85 OP5.3 29.23,23.29 28.6,22.67 28.6,15.67 R12.1

## Copper pours and planes (outline as drawn; the poured copper is in the pictures)
GND on Top Layer: 0,72 82,72 82,0 0,0
GND on Bottom Layer: 0,72 82,72 82,0 0,0

## Text on the board
Top Silkscreen Layer: WE | CE | RE
